# EasyEDA Pro project ProPrj_国赛底层板子_2026-05-31.epro, board 1-PCB_pcb3
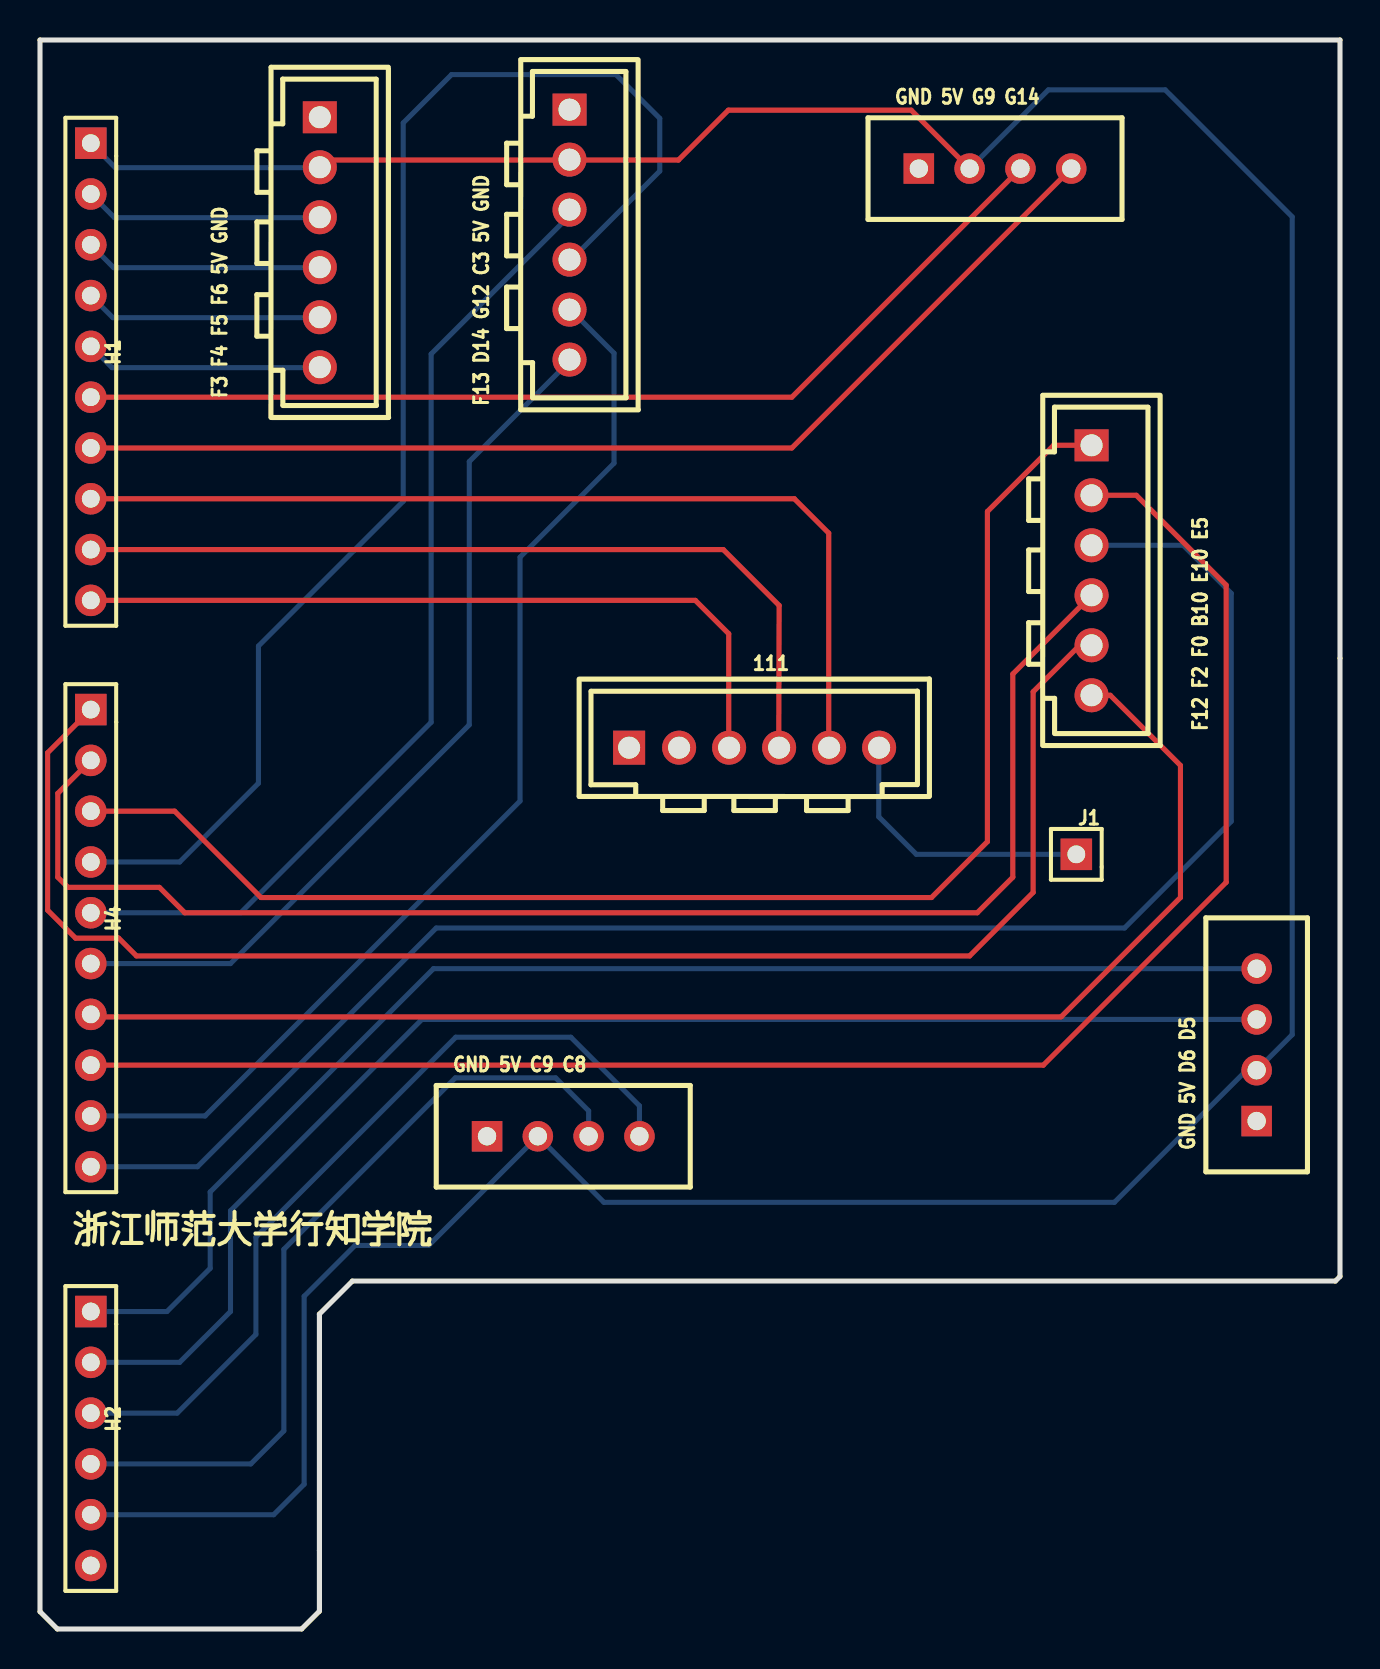
[diagram p11: board, top side]
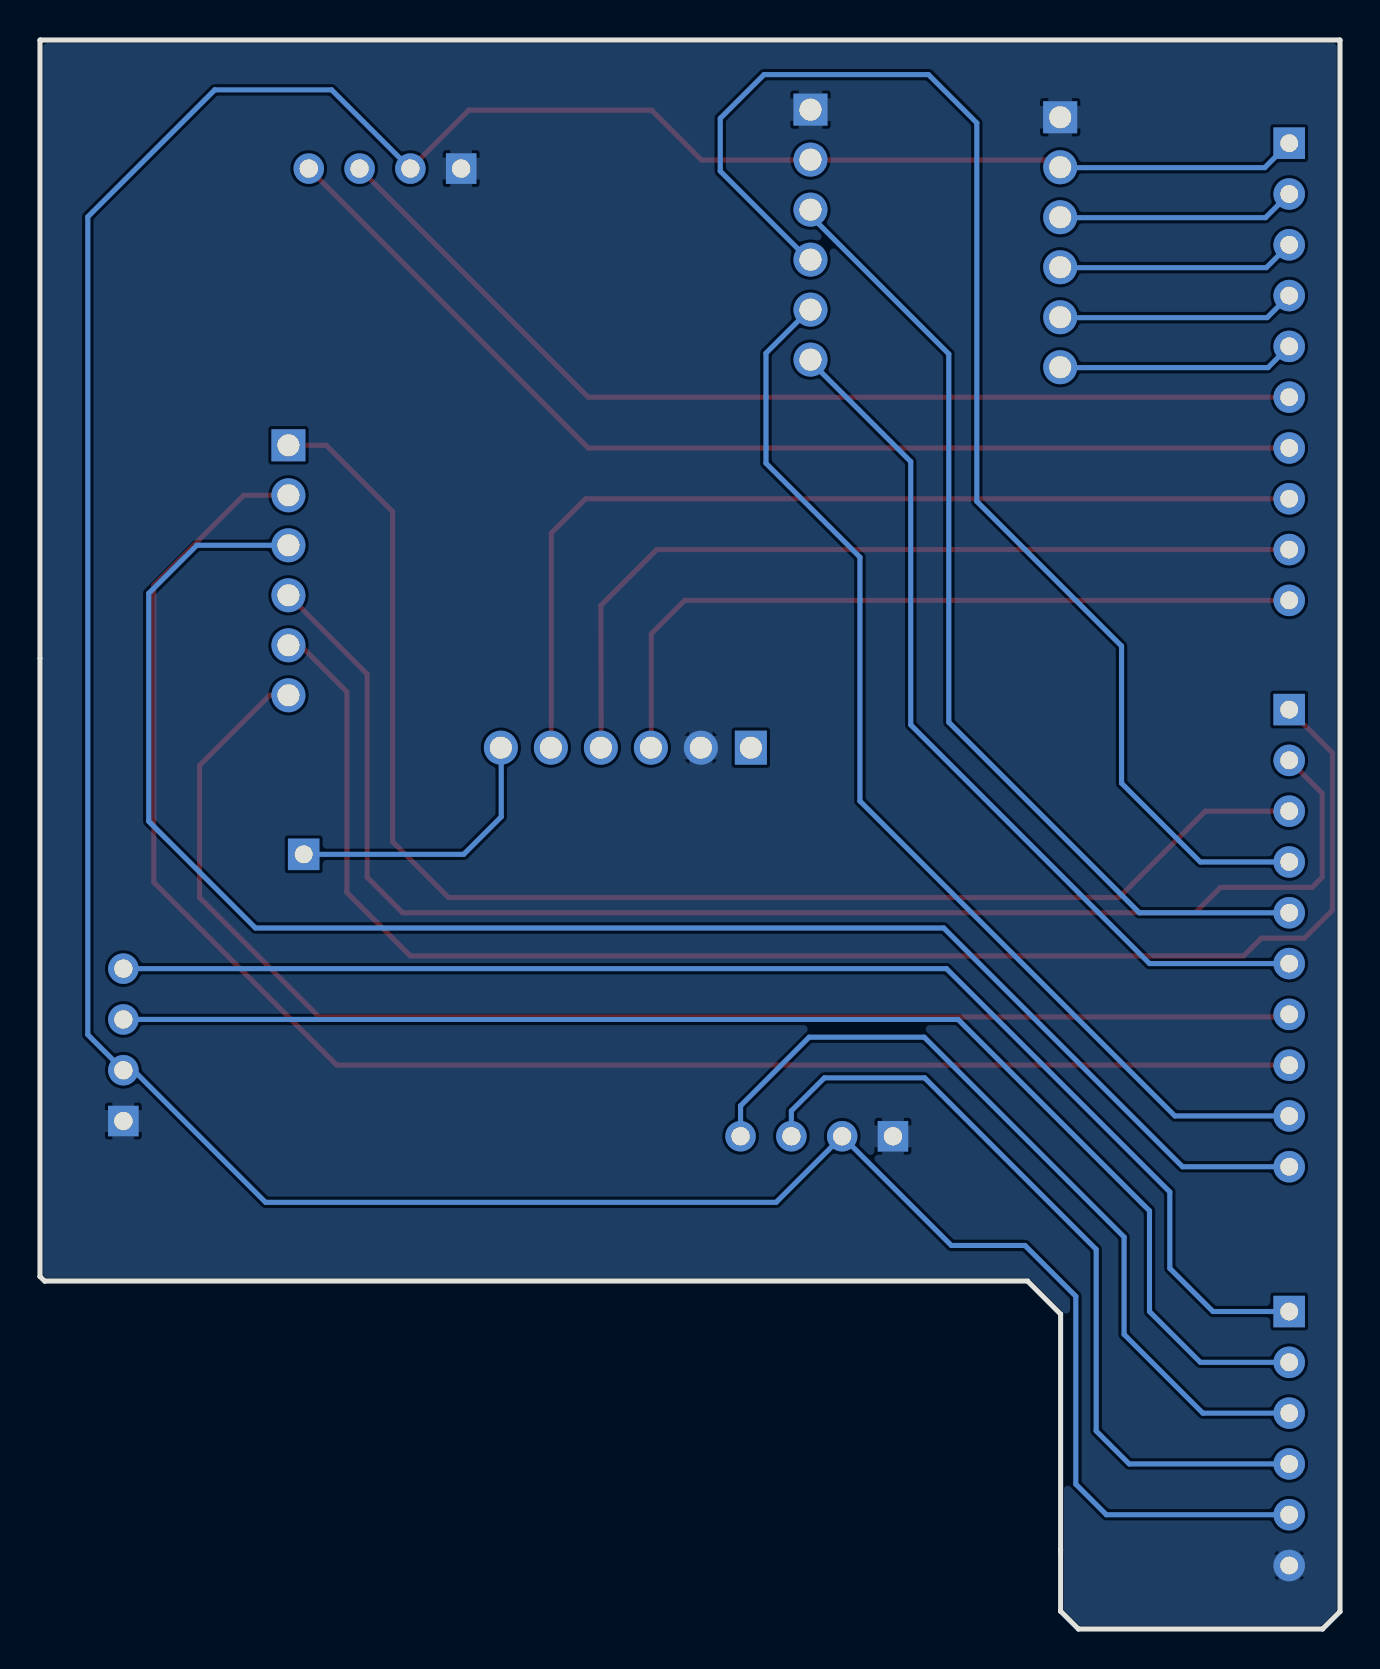
[diagram p12: board, bottom side, seen from below]

Outline 65 x 79.46 mm; copper layers: Top Layer, Bottom Layer. Coordinates in mm from the lower left corner of the outline.
Outline path: 0,79.46 65,79.46 65,17.63 64.77,17.4 15.62,17.4 13.97,15.75 13.97,0.89 13.08,0 0.87,0 0,0.87 0,79.46

## Design rules (mm)
spacing Default (default): track to track 0.152, other pairs 0 to 0.152
track width Default (default): min 0.254, default 0.254, max 25.4
via Default (default): diameter min 0.61, default 0.61, max 100.025; hole min 0.305, default 0.305, max 59.995
pour e161 uses gge5950

## Placement (name value [footprint] x y rotation side)
1  HC-XHB-6A  [CONN-TH_6P-P2.50_HCTL_HC-XHB-6A]  52.58 52.94 270 top
2  HC-XHB-6A  [CONN-TH_6P-P2.50_HCTL_HC-XHB-6A]  13.99 69.34 270 top
3  HC-XHB-6A  [CONN-TH_6P-P2.50_HCTL_HC-XHB-6A]  26.48 69.72 270 top
111  HC-XHB-6A  [CONN-TH_6P-P2.50_HCTL_HC-XHB-6A]  35.71 44.07 0 top
H1  HDR-F-2.54_1x10  [HDR-F-2.54_1X10]  2.54 62.87 270 top
H2  HDR-F-2.54_1x6  [HDR-F-2.54_1X6]  2.54 10.8 270 top
H4  HDR-F-2.54_1x10  [HDR-F-2.54_1X10]  2.54 34.54 270 top
J1  HDR-M-2.54_1x1  [HDR-M-2.54_1X1]  51.82 38.74 0 top
J3  TOF  [OLED10.96OLED]  43.94 73.03 0 top
J4  TOF  [OLED10.96OLED]  22.35 24.64 0 top
J5  TOF  [OLED10.96OLED]  60.83 25.4 90 top

## Footprints (pads in the part's own frame, mm; a bottom-side part is the same pattern mirrored in y, then rotated)
CONN-TH_6P-P2.50_HCTL_HC-XHB-6A
  rect 1.6x1.7 hole 1.1: 1(-6.25,0)
  round 1.7 hole 1.1: 2(-3.75,0) 3(-1.25,0) 4(1.25,0) 5(3.75,0) 6(6.25,0)
HDR-F-2.54_1X6
  rect 1.575x1.575 hole 0.889: 1(-5.08,0)
  round 1.575 hole 0.889: 2(-2.54,0) 3(0,0) 4(2.54,0) 5(5.08,0) 6(7.62,0)
HDR-F-2.54_1X10
  rect 1.575x1.575 hole 0.889: 1(-11.43,0)
  round 1.575 hole 0.889: 2(-8.89,0) 3(-6.35,0) 4(-3.81,0) 5(-1.27,0) 6(1.27,0) 7(3.81,0) 8(6.35,0) 9(8.89,0) 10(11.43,0)
HDR-M-2.54_1X1
  rect 1.575x1.575 hole 0.889: 1(0,0)
OLED10.96OLED
  rect 1.524x1.524 hole 0.914: 1(0,0)
  round 1.524 hole 0.914: 2(2.54,0) 3(5.08,0) 4(7.62,0)

## Nets
As in the schematic.

## Routing (per net, layer and track width the routed paths; a pad name or vN(x,y) marks a point on that pad's centre or on a via; arc(x,y) is an arc through that point)
5V: length 186.4
  Top Layer w0.254: 13.97,73.07 14.35,73.45 31.92,73.45 34.42,75.95 43.56,75.95 J3.2
  Bottom Layer w0.254: 13.97,73.07 3.76,73.07 H1.1 ; J3.2 50.42,76.96 56.26,76.96 62.61,70.61 62.61,29.72 J5.2 60.32,27.94 53.72,21.34 28.19,21.34 J4.2 19.43,19.18 15.75,19.18 13.21,16.64 13.21,7.24 11.68,5.72 H2.5
B10: length 83.6
  Bottom Layer w0.254: 2.54,23.11 7.87,23.11 19.81,35.05 54.23,35.05 59.56,40.39 59.56,51.79 57.16,54.19 1.3
C3: length 49.5
  Bottom Layer w0.254: 26.54,70.95 26.54,70.74 19.56,63.75 19.56,45.34 10.03,35.81 H4.5
C8: length 41
  Bottom Layer w0.254: J4.4 29.97,26.16 26.54,29.59 20.79,29.59 10.79,19.6 10.79,14.73 6.86,10.8 H2.3
C9: length 40.2
  Bottom Layer w0.254: J4.3 27.43,25.91 25.78,27.56 20.77,27.56 12.19,18.98 12.19,9.91 10.54,8.26 H2.4
D5: length 67.6
  Bottom Layer w0.254: H2.1 6.35,15.88 8.51,18.03 8.51,21.85 19.68,33.02 J5.4
D6: length 68.3
  Bottom Layer w0.254: H2.2 6.98,13.34 9.53,15.88 9.53,20.91 19.09,30.48 J5.3
D14: length 55.4
  Bottom Layer w0.254: 26.54,65.95 28.7,63.79 28.7,58.29 24,53.59 24,41.4 8.25,25.65 H4.9
E2: length 38.4
  Top Layer w0.254: 34.44,43.94 34.44,49.76 32.77,51.44 H1.10
E3: length 48.5
  Top Layer w0.254: H1.8 37.72,56.52 39.44,54.8 39.44,43.94
E4: length 42.8
  Top Layer w0.254: H1.9 34.16,53.98 36.96,51.18 36.94,43.94
E5: length 70.9
  Top Layer w0.254: H4.3 6.73,40.89 11.05,36.58 44.58,36.58 47.37,39.37 47.37,55.88 50.68,59.19 1.1
E10: length 84
  Top Layer w0.254: 1.2 54.82,56.69 59.31,52.2 59.31,37.34 50.16,28.19 H4.8
F0: length 71.5
  Top Layer w0.254: H4.2 0.89,41.78 0.89,37.59 1.4,37.08 5.97,37.08 7.24,35.81 46.86,35.81 48.64,37.59 48.64,47.75 1.4
F2: length 76.4
  Top Layer w0.254: H4.1 0.38,43.82 0.38,35.94 1.78,34.54 3.94,34.54 4.83,33.66 46.48,33.66 49.66,36.83 49.66,46.86 51.98,49.19 1.5
F3: length 11.9
  Bottom Layer w0.254: H1.5 3.6,63.07 13.97,63.07
F4: length 11.9
  Bottom Layer w0.254: H1.4 3.64,65.57 13.97,65.57
F5: length 11.9
  Bottom Layer w0.254: H1.3 3.68,68.07 13.97,68.07
F6: length 11.9
  Bottom Layer w0.254: H1.2 3.72,70.57 13.97,70.57
F12: length 69.5
  Top Layer w0.254: 1.6 53.51,46.69 57.02,43.18 57.02,36.58 51.05,30.61 2.67,30.61 H4.7
F13: length 44.2
  Bottom Layer w0.254: H4.6 9.53,33.27 21.46,45.21 21.46,58.37 26.54,63.45
G9: length 51.2
  Top Layer w0.254: J3.3 37.59,61.6 H1.6
G12: length 69.7
  Bottom Layer w0.254: H4.4 6.98,38.35 10.92,42.29 10.92,49.15 18.16,56.39 18.16,75.31 20.57,77.72 28.8,77.72 30.99,75.53 30.99,72.9 26.54,68.45
G14: length 54.8
  Top Layer w0.254: J3.4 37.59,59.06 H1.7
RST: length 14
  Bottom Layer w0.254: J1.1 43.81,38.74 41.94,40.61 41.94,43.94

## Copper pours and planes (outline as drawn; the poured copper is in the pictures)
GND on Bottom Layer: -4.06,82.42 69.98,82.42 71.25,81.15 71.25,2.67 58.42,-10.16 -17.4,-10.16 -18.42,-11.18 -18.42,-10.92

## Text on the board
Top Silkscreen Layer: GND 5V C9 C8 | GND 5V G9 G14 | F3 F4 F5 F6 5V GND | F13 D14 G12 C3 5V GND | GND 5V D6 D5 | F12 F2 F0 B10 E10 E5 | 浙江师范大学行知学院
